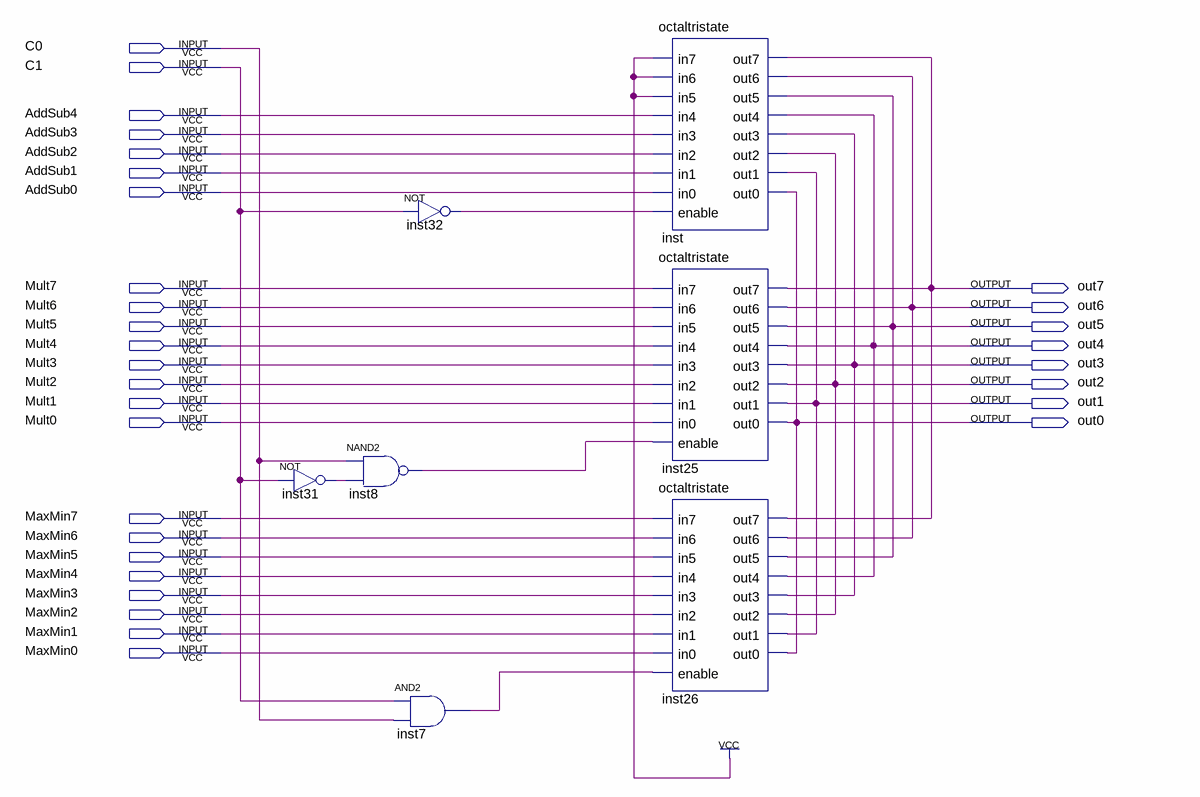
[diagram p0: schematic sheet]
// Quartus schematic calcout.bdf as structural Verilog: 7 symbols, 31 pins
module calcout (
  input  C0,
  input  C1,
  input  AddSub4,
  input  AddSub3,
  input  AddSub2,
  input  AddSub1,
  input  AddSub0,
  input  Mult7,
  input  Mult6,
  input  Mult5,
  input  Mult4,
  input  Mult3,
  input  Mult2,
  input  Mult1,
  input  Mult0,
  input  MaxMin7,
  input  MaxMin6,
  input  MaxMin5,
  input  MaxMin4,
  input  MaxMin3,
  input  MaxMin2,
  input  MaxMin1,
  input  MaxMin0,
  output out7,
  output out6,
  output out5,
  output out4,
  output out3,
  output out2,
  output out1,
  output out0
);

  wire inst7_out, inst8_out, inst31_out, inst32_out;

  not inst31 (inst31_out, C1);
  not inst32 (inst32_out, C1);
  nand inst8 (inst8_out, C0, inst31_out);
  and inst7 (inst7_out, C1, C0);
  octaltristate inst (
    .in7(1'b1), .in6(1'b1), .in5(1'b1), .in4(AddSub4), .in3(AddSub3), .in2(AddSub2), .in1(AddSub1),
    .in0(AddSub0), .enable(inst32_out), .out7(out7), .out6(out6), .out5(out5), .out4(out4), .out3(out3),
    .out2(out2), .out1(out1), .out0(out0));
  octaltristate inst25 (
    .in7(Mult7), .in6(Mult6), .in5(Mult5), .in4(Mult4), .in3(Mult3), .in2(Mult2), .in1(Mult1), .in0(Mult0),
    .enable(inst8_out), .out7(out7), .out6(out6), .out5(out5), .out4(out4), .out3(out3), .out2(out2),
    .out1(out1), .out0(out0));
  octaltristate inst26 (
    .in7(MaxMin7), .in6(MaxMin6), .in5(MaxMin5), .in4(MaxMin4), .in3(MaxMin3), .in2(MaxMin2), .in1(MaxMin1),
    .in0(MaxMin0), .enable(inst7_out), .out7(out7), .out6(out6), .out5(out5), .out4(out4), .out3(out3),
    .out2(out2), .out1(out1), .out0(out0));
endmodule
